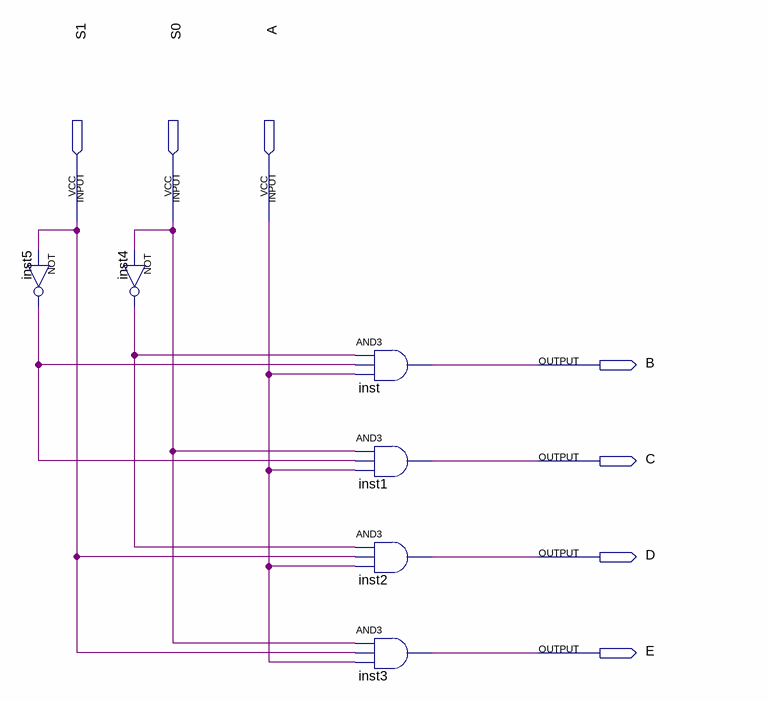
[diagram p0: schematic sheet]
// Quartus schematic Lab1Decoder.bdf as structural Verilog: 6 symbols, 7 pins
module Lab1Decoder (
  input  S1,
  input  S0,
  input  A,
  output B,
  output C,
  output D,
  output E
);

  wire inst4_out, inst5_out;

  not inst5 (inst5_out, S1);
  not inst4 (inst4_out, S0);
  and inst (B, inst4_out, inst5_out, A);
  and inst1 (C, S0, inst5_out, A);
  and inst2 (D, inst4_out, S1, A);
  and inst3 (E, S0, S1, A);
endmodule
